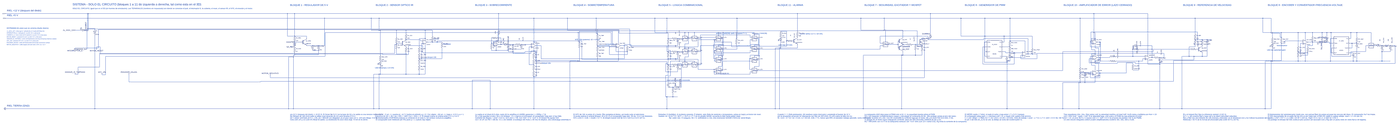
[diagram p0: schematic SISTEMA_SOLO_CIRCUITO.asc, whole sheet]
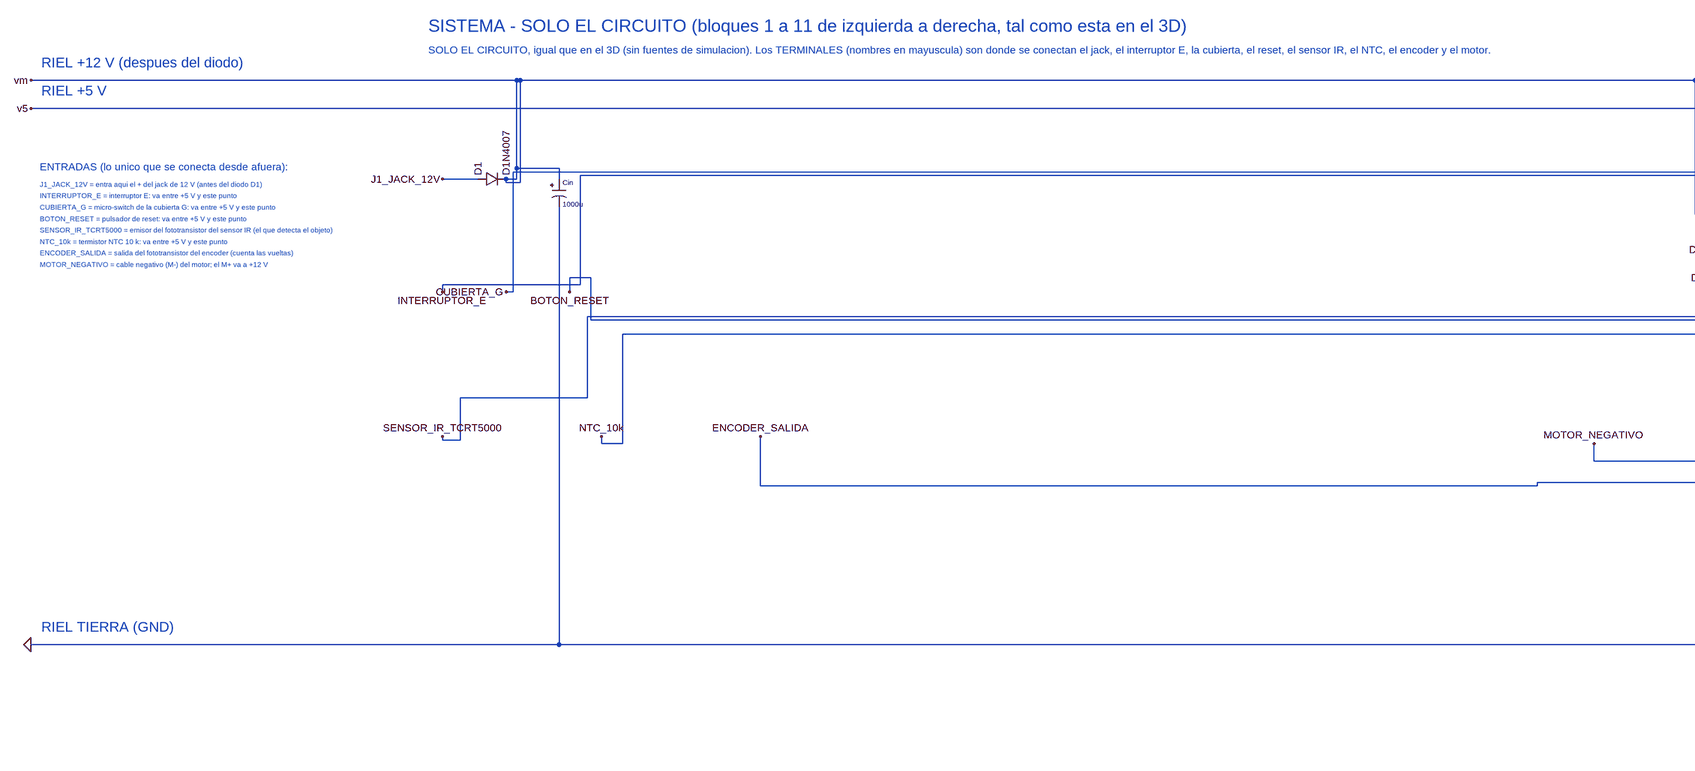
[diagram p1: schematic SISTEMA_SOLO_CIRCUITO.asc, part, row 1 of 1, column 1 of 5]
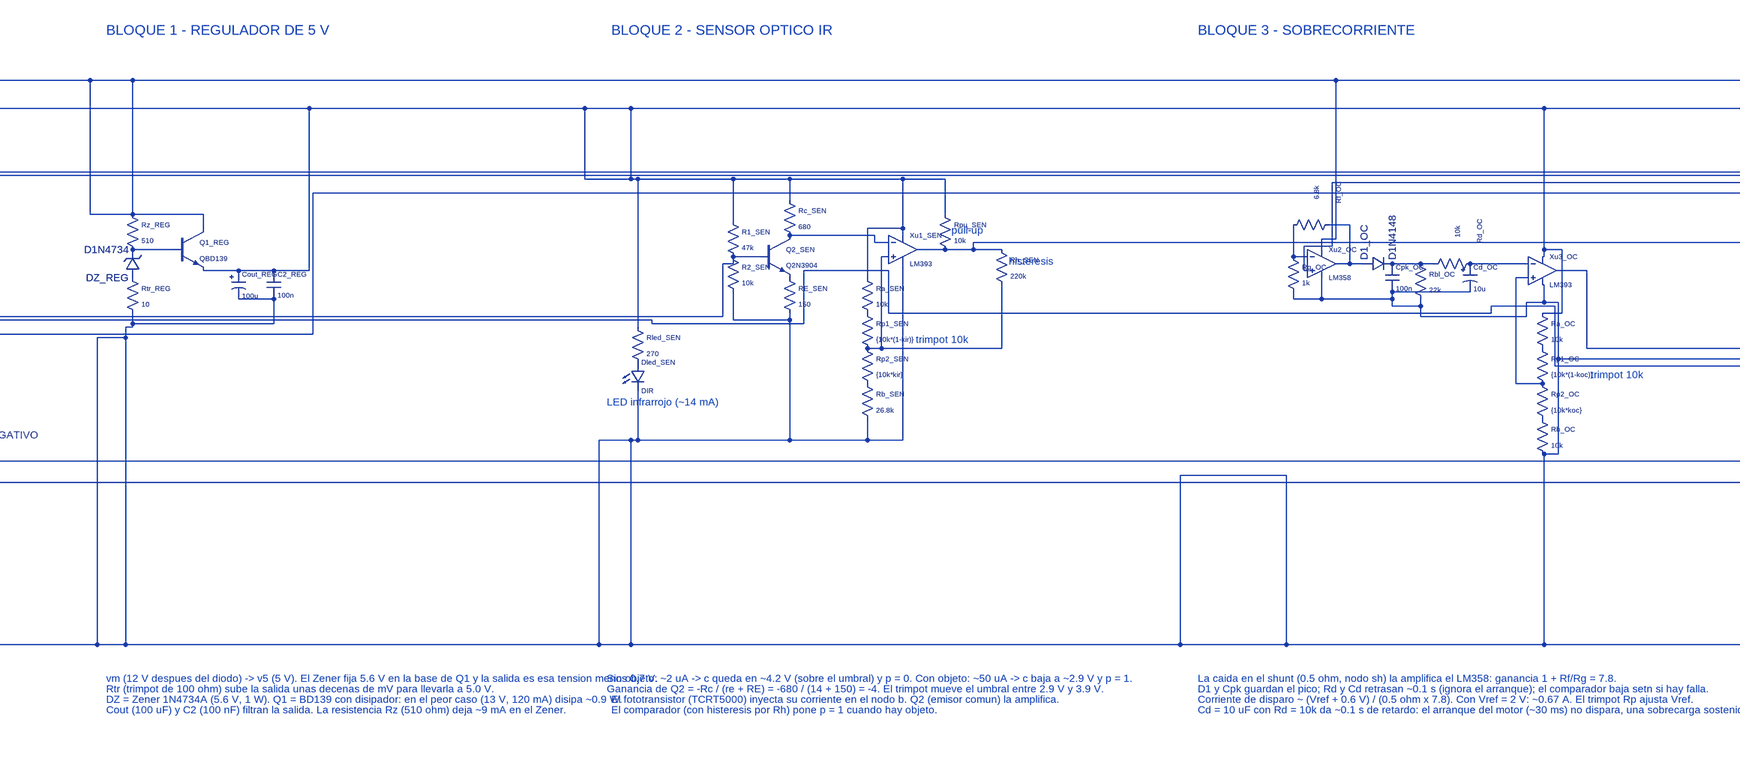
[diagram p2: schematic SISTEMA_SOLO_CIRCUITO.asc, part, row 1 of 1, column 2 of 5]
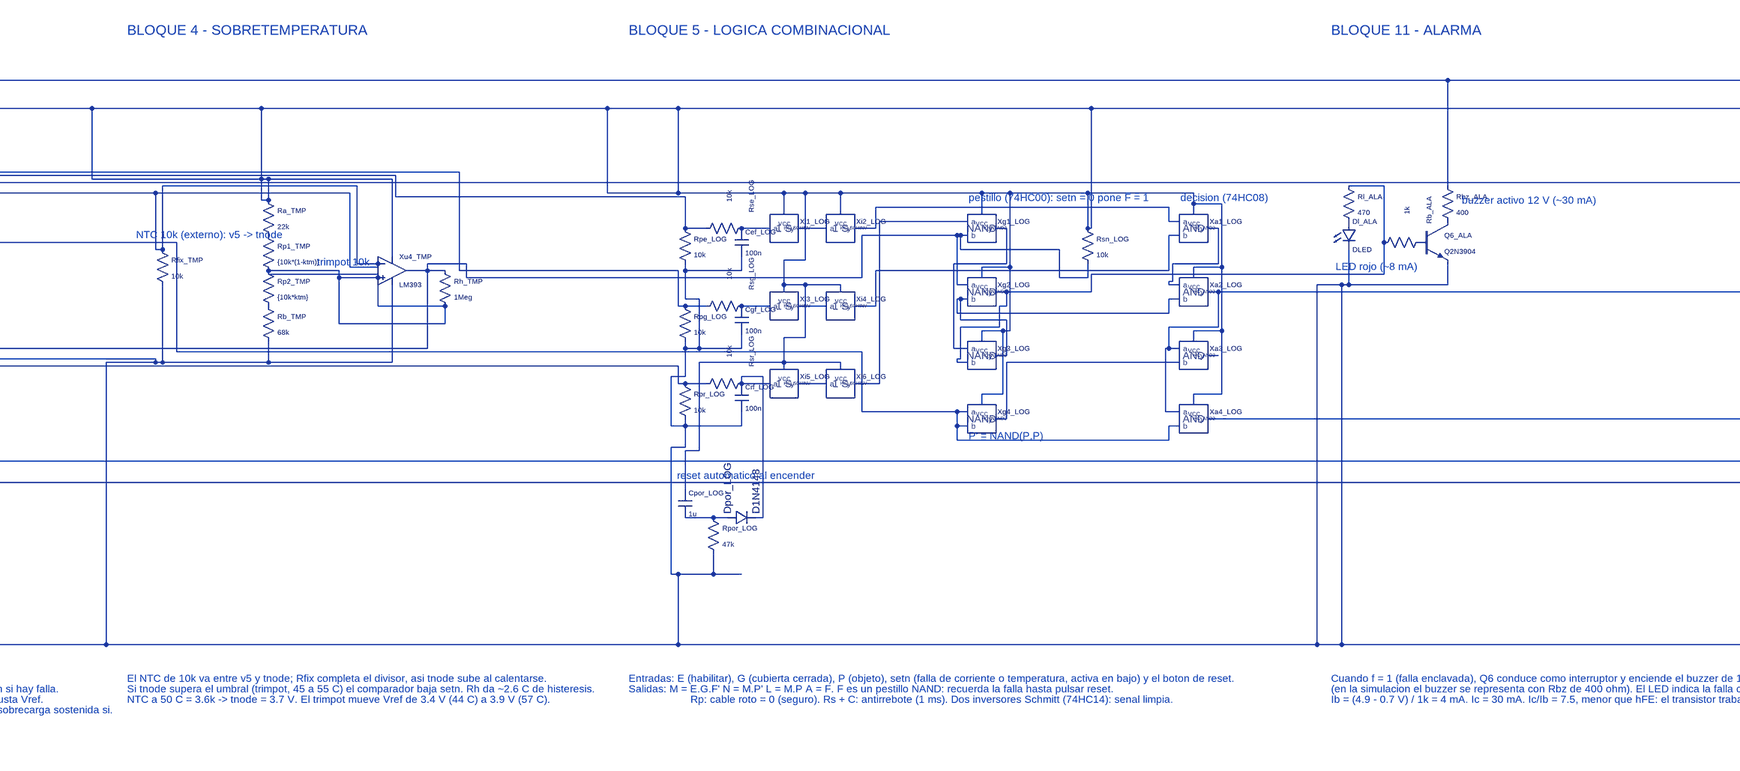
[diagram p3: schematic SISTEMA_SOLO_CIRCUITO.asc, part, row 1 of 1, column 3 of 5]
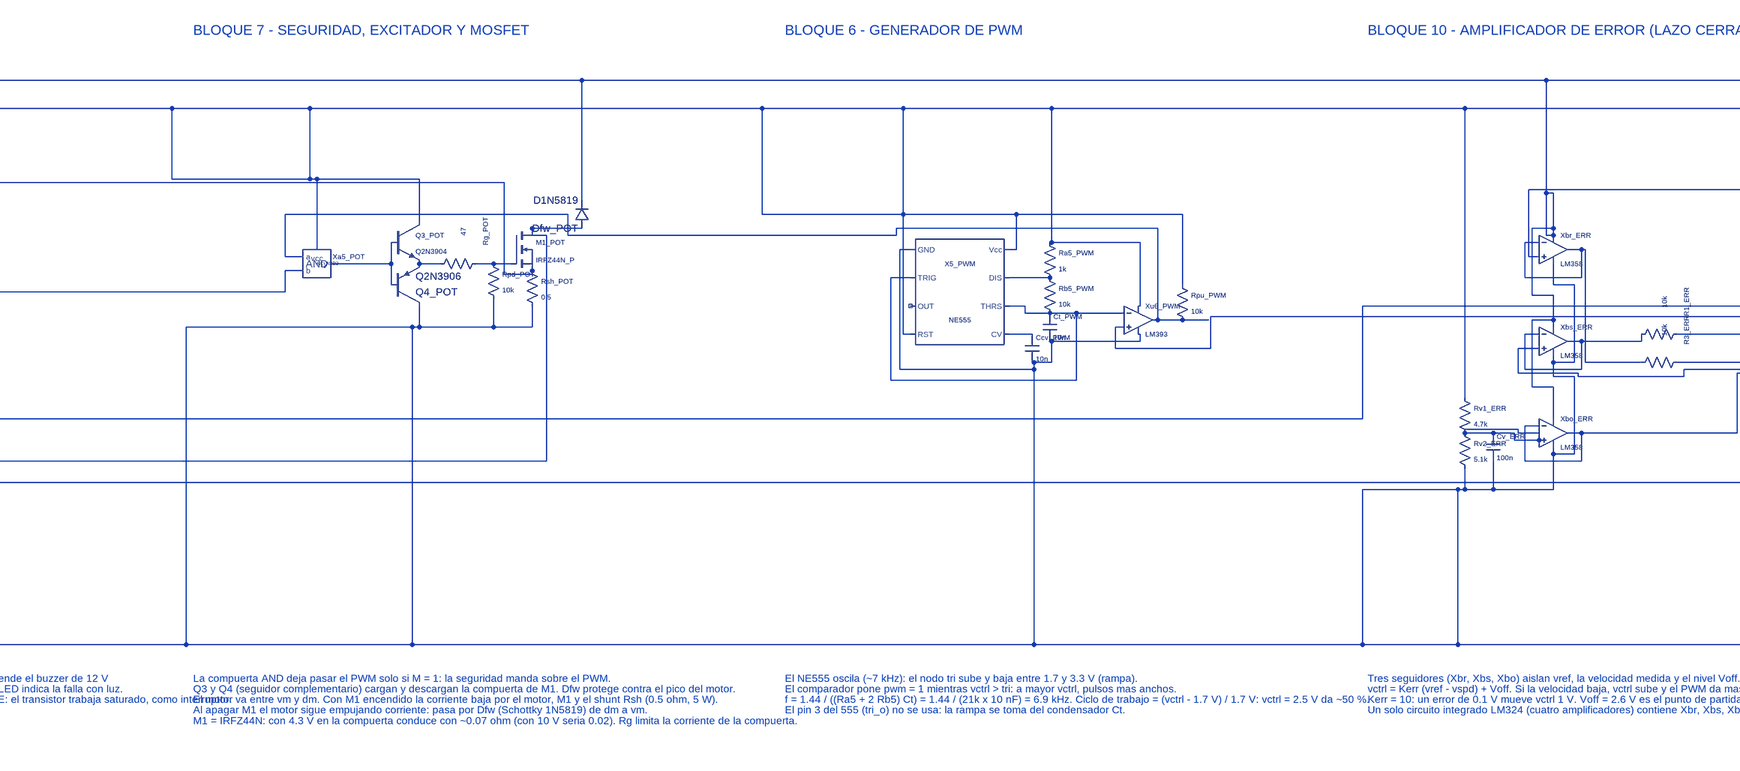
[diagram p4: schematic SISTEMA_SOLO_CIRCUITO.asc, part, row 1 of 1, column 4 of 5]
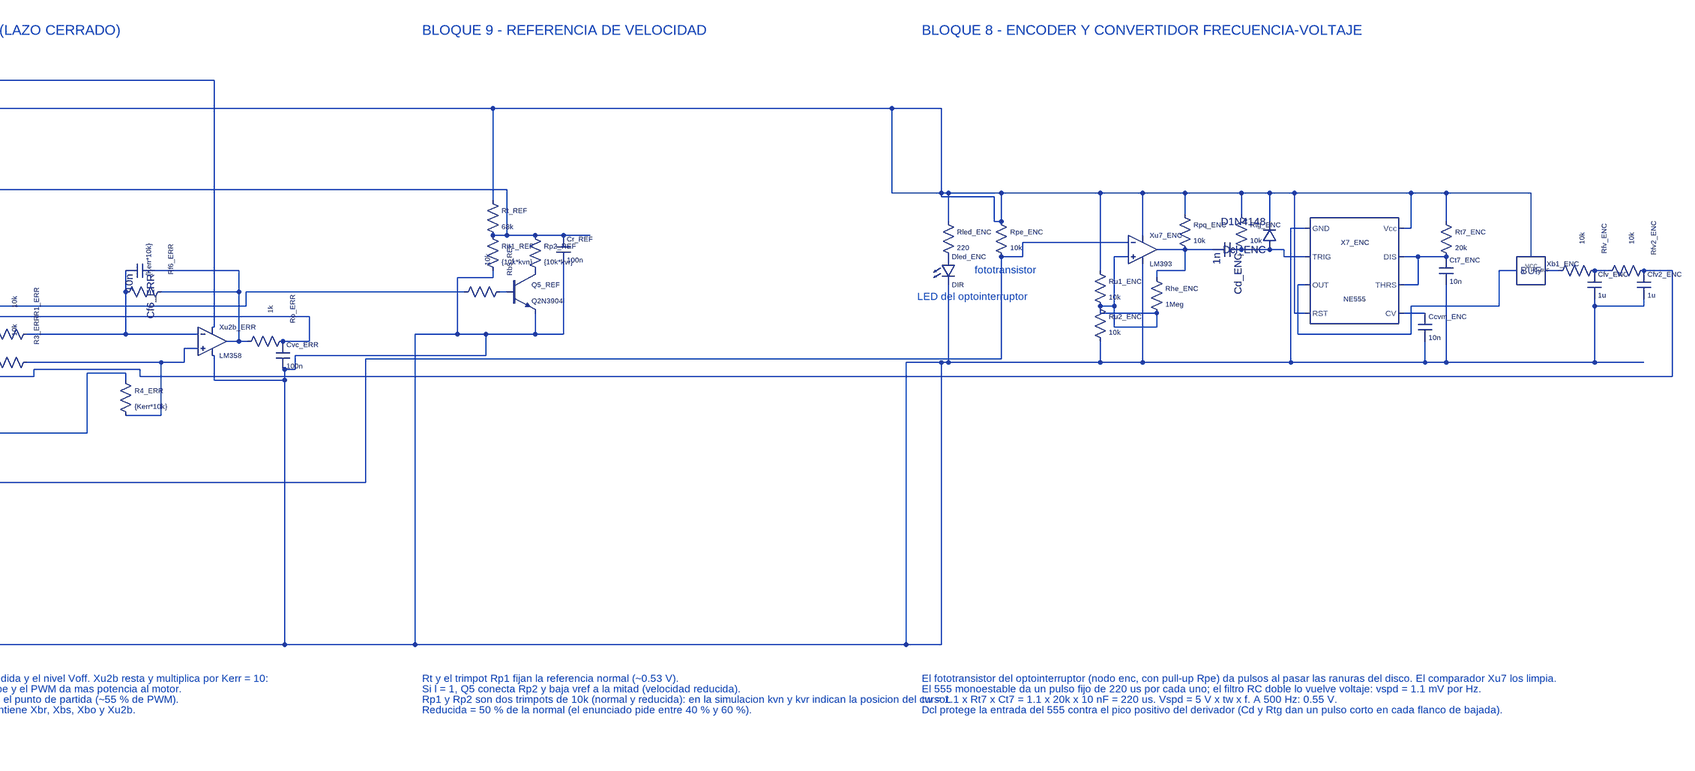
[diagram p5: schematic SISTEMA_SOLO_CIRCUITO.asc, part, row 1 of 1, column 5 of 5]
SISTEMA_SOLO_CIRCUITO.asc, the LTspice schematic file:
Version 4
SHEET 1 21000 4000
WIRE 4368 208 4464 208
WIRE 4368 128 4528 128
WIRE 4528 128 4528 160
WIRE 4528 256 4768 256
WIRE 5728 224 5792 224
WIRE 5856 176 6048 176
WIRE 6048 176 6048 192
WIRE 6048 192 6080 192
WIRE 6032 432 6064 432
WIRE 6064 224 6064 432
WIRE 6064 224 6080 224
WIRE 6144 208 6208 208
WIRE 6208 208 6272 208
WIRE 6272 208 6336 208
WIRE 6336 288 6336 432
WIRE 6064 432 6336 432
WIRE 5496 48 6208 48
WIRE 5856 48 5856 96
WIRE 6208 48 6208 128
WIRE 5728 48 5728 144
WIRE 6112 48 6112 176
WIRE 6032 160 6032 272
WIRE 6032 160 6112 160
WIRE 5512 48 5512 384
WIRE 5496 640 6112 640
WIRE 6032 592 6032 640
WIRE 5512 528 5512 640
WIRE 5856 352 5856 640
WIRE 5728 304 5728 368
WIRE 5728 368 5856 368
WIRE 6112 240 6112 640
WIRE 7000 224 7032 224
WIRE 7000 152 7000 224
WIRE 7080 152 7128 152
WIRE 7128 152 7128 240
WIRE 7096 240 7128 240
WIRE 7128 240 7160 240
WIRE 7224 240 7288 240
WIRE 7288 240 7320 240
WIRE 7400 240 7532 240
WIRE 7596 256 7664 256
WIRE 7504 512 7564 512
WIRE 7504 272 7504 512
WIRE 7504 272 7532 272
WIRE 8728 256 8776 256
WIRE 8776 256 8816 256
WIRE 8176 64 8176 208
WIRE 8176 64 8616 64
WIRE 8616 64 8616 240
WIRE 8616 240 8664 240
WIRE 8416 256 8576 256
WIRE 8576 256 8576 272
WIRE 8576 272 8664 272
WIRE 8816 336 8816 376
WIRE 8576 376 8816 376
WIRE 8576 272 8576 376
WIRE 8400 48 8696 48
WIRE 8416 48 8416 96
WIRE 8696 48 8696 224
WIRE 8160 464 8696 464
WIRE 8416 416 8416 464
WIRE 8176 288 8176 464
WIRE 8696 288 8696 464
WIRE 9360 160 9408 160
WIRE 9488 160 9552 160
WIRE 9616 160 9680 160
WIRE 9744 160 9792 160
WIRE 9360 336 9408 336
WIRE 9488 336 9552 336
WIRE 9616 336 9680 336
WIRE 9744 336 9792 336
WIRE 9360 512 9408 512
WIRE 9488 512 9552 512
WIRE 9616 512 9680 512
WIRE 9744 512 9792 512
WIRE 9360 816 9424 816
WIRE 9424 816 9456 816
WIRE 10064 160 10088 160
WIRE 10032 104 10032 128
WIRE 9976 144 10000 144
WIRE 9976 176 10000 176
WIRE 10064 304 10088 304
WIRE 10032 248 10032 272
WIRE 9976 288 10000 288
WIRE 9976 320 10000 320
WIRE 10064 448 10088 448
WIRE 10032 392 10032 416
WIRE 9976 432 10000 432
WIRE 9976 464 10000 464
WIRE 10064 592 10088 592
WIRE 10032 536 10032 560
WIRE 9976 576 10000 576
WIRE 9976 608 10000 608
WIRE 10544 160 10568 160
WIRE 10512 104 10512 128
WIRE 10456 144 10480 144
WIRE 10456 176 10480 176
WIRE 10544 304 10568 304
WIRE 10512 248 10512 272
WIRE 10456 288 10480 288
WIRE 10456 320 10480 320
WIRE 10544 448 10568 448
WIRE 10512 392 10512 416
WIRE 10456 432 10480 432
WIRE 10456 464 10480 464
WIRE 10544 592 10568 592
WIRE 10512 536 10512 560
WIRE 10456 576 10480 576
WIRE 10456 608 10480 608
WIRE 10456 112 10456 144
WIRE 9792 112 10456 112
WIRE 9792 112 9792 160
WIRE 10456 320 10456 352
WIRE 9976 352 10456 352
WIRE 9976 320 9976 352
WIRE 10456 176 10456 256
WIRE 9792 256 10456 256
WIRE 9792 256 9792 336
WIRE 10448 576 10456 576
WIRE 10448 432 10448 576
WIRE 10448 432 10456 432
WIRE 10568 160 10568 240
WIRE 10464 240 10568 240
WIRE 10464 240 10464 280
WIRE 10456 280 10464 280
WIRE 10456 280 10456 288
WIRE 10456 608 10456 640
WIRE 9976 640 10456 640
WIRE 9976 608 9976 640
WIRE 10088 464 10456 464
WIRE 10088 464 10088 592
WIRE 10088 160 10088 240
WIRE 9968 240 10088 240
WIRE 9968 240 9968 432
WIRE 9968 432 9976 432
WIRE 9520 816 9536 816
WIRE 9536 496 9536 816
WIRE 9488 496 9536 496
WIRE 9488 496 9488 512
WIRE 9800 144 9976 144
WIRE 9800 144 9800 512
WIRE 9792 512 9800 512
WIRE 9976 176 9976 288
WIRE 9344 80 10512 80
WIRE 10032 80 10032 104
WIRE 10512 80 10512 104
WIRE 9584 80 9584 128
WIRE 9712 80 9712 128
WIRE 10272 80 10272 160
WIRE 10032 248 10096 248
WIRE 10096 80 10096 248
WIRE 10512 248 10576 248
WIRE 10576 104 10576 248
WIRE 10512 104 10576 104
WIRE 10032 392 10096 392
WIRE 10096 248 10096 392
WIRE 10512 392 10576 392
WIRE 10576 248 10576 392
WIRE 10032 536 10080 536
WIRE 10080 392 10080 536
WIRE 10512 536 10576 536
WIRE 10576 392 10576 536
WIRE 9584 232 9584 304
WIRE 9584 232 9632 232
WIRE 9632 80 9632 232
WIRE 9712 288 9712 304
WIRE 9584 288 9712 288
WIRE 9584 408 9584 480
WIRE 9584 408 9632 408
WIRE 9632 288 9632 408
WIRE 9712 464 9712 480
WIRE 9584 464 9712 464
WIRE 9360 664 9360 752
WIRE 9360 664 9392 664
WIRE 9392 464 9392 664
WIRE 9392 464 9584 464
WIRE 9344 944 9488 944
WIRE 9424 896 9424 944
WIRE 9360 592 9360 656
WIRE 9328 656 9360 656
WIRE 9328 656 9328 944
WIRE 9328 944 9344 944
WIRE 9488 576 9488 608
WIRE 9360 608 9488 608
WIRE 9360 416 9360 496
WIRE 9328 496 9360 496
WIRE 9328 496 9328 608
WIRE 9328 608 9360 608
WIRE 9488 400 9488 432
WIRE 9360 432 9488 432
WIRE 9360 240 9360 320
WIRE 9360 320 9392 320
WIRE 9392 320 9392 432
WIRE 9488 224 9488 256
WIRE 9360 256 9488 256
WIRE 10992 288 11232 288
WIRE 11232 240 11232 288
WIRE 11008 208 11008 288
WIRE 12336 224 12376 224
WIRE 12336 256 12376 256
WIRE 12440 240 12576 240
WIRE 12576 192 12576 240
WIRE 12576 240 12576 288
WIRE 12640 240 12688 240
WIRE 12768 240 12848 240
WIRE 12896 160 13008 160
WIRE 12392 48 12640 48
WIRE 12640 48 12640 144
WIRE 12408 48 12408 208
WIRE 12624 384 12896 384
WIRE 12640 336 12640 384
WIRE 12896 336 12896 384
WIRE 12808 320 12808 384
WIRE 13976 272 14068 272
WIRE 13976 336 14012 336
WIRE 14012 336 14012 352
WIRE 14012 352 14068 352
WIRE 13976 400 14028 400
WIRE 14068 352 14128 352
WIRE 14128 352 14236 352
WIRE 13708 272 13752 272
WIRE 13708 272 13708 504
WIRE 13708 504 14128 504
WIRE 14128 352 14128 504
WIRE 14300 368 14368 368
WIRE 14368 368 14428 368
WIRE 13736 128 14368 128
WIRE 13976 208 13992 208
WIRE 13992 128 13992 208
WIRE 14368 128 14368 288
WIRE 13736 400 13752 400
WIRE 13736 128 13736 400
WIRE 15240 208 15272 208
WIRE 15272 208 15272 272
WIRE 15144 272 15272 272
WIRE 15144 192 15144 272
WIRE 15144 192 15176 192
WIRE 15240 416 15272 416
WIRE 15272 416 15272 480
WIRE 15144 480 15272 480
WIRE 15144 400 15144 480
WIRE 15144 400 15176 400
WIRE 15240 624 15272 624
WIRE 15272 624 15272 688
WIRE 15144 688 15272 688
WIRE 15144 608 15144 688
WIRE 15144 608 15176 608
WIRE 15008 624 15072 624
WIRE 15072 624 15120 624
WIRE 15120 624 15120 640
WIRE 15120 640 15176 640
WIRE 15488 400 15712 400
WIRE 15712 400 15876 400
WIRE 15488 464 15712 464
WIRE 15712 464 15792 464
WIRE 15792 464 15844 464
WIRE 15844 432 15844 464
WIRE 15844 432 15876 432
WIRE 15712 584 15792 584
WIRE 15792 464 15792 584
WIRE 15712 304 15712 400
WIRE 15792 304 15968 304
WIRE 15712 256 15712 304
WIRE 15776 256 15968 256
WIRE 15968 256 15968 304
WIRE 15968 304 15968 416
WIRE 15940 416 15968 416
WIRE 15968 416 15988 416
WIRE 16068 416 16128 416
WIRE 15712 488 15712 504
WIRE 15624 488 15712 488
WIRE 15624 488 15624 624
WIRE 15272 624 15624 624
WIRE 15280 464 15408 464
WIRE 15280 208 15280 464
WIRE 15272 208 15280 208
WIRE 15408 400 15408 416
WIRE 15272 416 15408 416
WIRE 15192 80 15208 80
WIRE 15208 80 15208 176
WIRE 15208 312 15208 384
WIRE 15160 312 15208 312
WIRE 15160 160 15160 312
WIRE 15160 160 15208 160
WIRE 15208 520 15208 592
WIRE 15160 520 15208 520
WIRE 15160 368 15160 520
WIRE 15160 368 15208 368
WIRE 14992 752 15208 752
WIRE 15008 704 15008 752
WIRE 15072 688 15072 752
WIRE 15208 656 15208 752
WIRE 15208 448 15208 496
WIRE 15208 496 15256 496
WIRE 15256 496 15256 672
WIRE 15208 672 15256 672
WIRE 15208 240 15208 288
WIRE 15208 288 15256 288
WIRE 15256 288 15256 464
WIRE 15208 464 15256 464
WIRE 16688 176 16784 176
WIRE 16784 176 16848 176
WIRE 16848 176 16908 176
WIRE 16704 304 16720 304
WIRE 16672 400 16848 400
WIRE 16784 352 16784 400
WIRE 16688 256 16688 272
WIRE 16608 272 16688 272
WIRE 16608 272 16608 400
WIRE 16848 240 16848 400
WIRE 17840 224 17888 224
WIRE 17888 192 17888 224
WIRE 17888 192 18128 192
WIRE 18064 336 18096 336
WIRE 18096 224 18096 336
WIRE 18096 224 18128 224
WIRE 18192 208 18256 208
WIRE 18256 208 18320 208
WIRE 18192 352 18192 384
WIRE 18096 384 18192 384
WIRE 18096 336 18096 384
WIRE 18384 208 18448 208
WIRE 18448 208 18480 208
WIRE 18480 208 18480 224
WIRE 18480 224 18528 224
WIRE 18752 224 18784 224
WIRE 18784 224 18784 288
WIRE 18752 288 18784 288
WIRE 18784 224 18848 224
WIRE 18752 352 18800 352
WIRE 18968 256 19008 256
WIRE 19072 256 19104 256
WIRE 19184 256 19216 256
WIRE 19296 256 19360 256
WIRE 18256 208 18256 256
WIRE 18192 256 18256 256
WIRE 18192 256 18192 272
WIRE 18968 256 18968 336
WIRE 18768 336 18968 336
WIRE 18768 336 18768 400
WIRE 18512 400 18768 400
WIRE 18512 288 18512 400
WIRE 18512 288 18528 288
WIRE 17704 80 19040 80
WIRE 18256 80 18256 128
WIRE 18384 80 18384 128
WIRE 17720 80 17720 144
WIRE 17840 80 17840 144
WIRE 18448 80 18448 144
WIRE 18848 80 18848 144
WIRE 18752 160 18768 160
WIRE 18768 80 18768 160
WIRE 18160 80 18160 176
WIRE 19040 80 19040 224
WIRE 18064 80 18064 256
WIRE 18504 352 18528 352
WIRE 18504 80 18504 352
WIRE 17704 464 19296 464
WIRE 18064 416 18064 464
WIRE 18800 416 18800 464
WIRE 19184 320 19184 464
WIRE 19296 320 19296 336
WIRE 19184 336 19296 336
WIRE 17720 288 17720 464
WIRE 18848 288 18848 464
WIRE 18160 240 18160 464
WIRE 18496 160 18528 160
WIRE 18496 160 18496 464
WIRE -900 -112 17704 -112
WIRE -900 -176 15912 -176
WIRE -900 1104 17704 1104
WIRE 4272 128 4368 128
WIRE 4272 -176 4272 128
WIRE 4288 408 4352 408
WIRE 4288 408 4288 1104
WIRE 5392 48 5496 48
WIRE 5392 -112 5392 48
WIRE 5424 640 5496 640
WIRE 5424 640 5424 1104
WIRE 6744 720 6984 720
WIRE 6744 720 6744 1104
WIRE 8016 48 8400 48
WIRE 8016 -112 8016 48
WIRE 8048 464 8160 464
WIRE 8048 464 8048 1104
WIRE 9184 80 9344 80
WIRE 9184 -112 9184 80
WIRE 10936 288 10992 288
WIRE 10936 288 10936 1104
WIRE 12080 48 12392 48
WIRE 12080 -112 12080 48
WIRE 12112 384 12624 384
WIRE 12112 384 12112 1104
WIRE 13416 128 13736 128
WIRE 13416 -112 13416 128
WIRE 14776 752 14992 752
WIRE 14776 752 14776 1104
WIRE 16512 400 16672 400
WIRE 16512 400 16512 1104
WIRE 17592 80 17704 80
WIRE 17592 -112 17592 80
WIRE 17624 464 17704 464
WIRE 17624 464 17624 1104
WIRE 12896 160 12896 176
WIRE 12896 176 12928 176
WIRE 12928 176 12928 688
WIRE 2784 688 12928 688
WIRE 2784 648 2784 688
WIRE 9360 88 9360 160
WIRE 8704 88 9360 88
WIRE 8704 40 8704 88
WIRE 344 40 8704 40
WIRE 344 40 344 288
WIRE 32 288 344 288
WIRE 32 288 32 304
WIRE 17840 224 17840 456
WIRE 16376 456 17840 456
WIRE 16376 456 16376 736
WIRE 2656 736 16376 736
WIRE 2656 736 2656 744
WIRE 752 744 2656 744
WIRE 752 632 752 744
WIRE 10088 368 10088 448
WIRE 9984 368 10088 368
WIRE 9984 320 9984 368
WIRE 9344 336 9360 336
WIRE 9344 256 9344 336
WIRE 8848 256 9344 256
WIRE 8848 32 8848 256
WIRE 192 32 8848 32
WIRE 192 32 192 304
WIRE 176 304 192 304
WIRE 15984 304 16624 304
WIRE 15984 304 15984 336
WIRE 14776 336 15984 336
WIRE 14776 336 14776 592
WIRE 10568 592 14776 592
WIRE 9344 512 9360 512
WIRE 9344 472 9344 512
WIRE 7592 472 9344 472
WIRE 7592 336 7592 472
WIRE 7448 336 7592 336
WIRE 7448 336 7448 352
WIRE 6080 352 7448 352
WIRE 6080 256 6080 352
WIRE 5888 256 6080 256
WIRE 5888 256 5888 376
WIRE 5544 376 5888 376
WIRE 5544 368 5544 376
WIRE 368 368 5544 368
WIRE 368 272 368 368
WIRE 320 272 368 272
WIRE 320 272 320 304
WIRE 19360 256 19360 496
WIRE 15744 496 19360 496
WIRE 15744 480 15744 496
WIRE 15504 480 15744 480
WIRE 15504 480 15504 496
WIRE 15264 496 15504 496
WIRE 15264 488 15264 496
WIRE 15128 488 15264 488
WIRE 15128 432 15128 488
WIRE 15128 432 15176 432
WIRE 10568 304 10568 384
WIRE 10456 384 10568 384
WIRE 10456 384 10456 432
WIRE 12336 256 12336 304
WIRE 10568 304 12336 304
WIRE 9760 576 9976 576
WIRE 9760 440 9760 576
WIRE 8208 440 9760 440
WIRE 8208 192 8208 440
WIRE 6272 192 8208 192
WIRE 6272 192 6272 208
WIRE 9976 576 9976 608
WIRE 8160 208 8176 208
WIRE 8160 80 8160 208
WIRE 4776 80 8160 80
WIRE 4776 80 4776 400
WIRE 440 400 4776 400
WIRE 440 400 440 648
WIRE 392 648 440 648
WIRE 392 632 392 648
WIRE 8664 240 8664 248
WIRE 8600 248 8664 248
WIRE 8600 80 8600 248
WIRE 8160 80 8600 80
WIRE 8776 256 8776 432
WIRE 7664 432 8776 432
WIRE 7664 256 7664 432
WIRE 9760 176 9976 176
WIRE 9760 176 9760 272
WIRE 8864 272 9760 272
WIRE 8864 240 8864 272
WIRE 8776 240 8864 240
WIRE 8776 240 8776 256
WIRE 10272 240 10272 272
WIRE 10208 272 10272 272
WIRE 10208 208 10208 272
WIRE 9984 208 10208 208
WIRE 9984 176 9984 208
WIRE 5728 224 5728 240
WIRE 5704 240 5728 240
WIRE 5704 240 5704 360
WIRE 360 360 5704 360
WIRE 360 360 360 544
WIRE 72 544 360 544
WIRE 72 544 72 640
WIRE 32 640 72 640
WIRE 32 632 32 640
WIRE 18064 352 18192 352
WIRE 18064 336 18064 352
WIRE 15176 624 15176 640
WIRE 15128 624 15176 624
WIRE 15128 616 15128 624
WIRE 15008 616 15128 616
WIRE 15008 616 15008 624
WIRE 12896 256 12896 264
WIRE 12832 264 12896 264
WIRE 12832 56 12832 264
WIRE 7088 56 12832 56
WIRE 7088 56 7088 200
WIRE 7024 200 7088 200
WIRE 7024 200 7024 256
WIRE 7024 256 7032 256
WIRE 8664 264 8664 272
WIRE 8416 264 8664 264
WIRE 8416 256 8416 264
WIRE 8664 336 8816 336
WIRE 8664 272 8664 336
WIRE 10088 304 10088 336
WIRE 10072 336 10088 336
WIRE 10072 336 10072 384
WIRE 9984 384 10072 384
WIRE 9984 384 9984 456
WIRE 9976 456 9984 456
WIRE 9976 456 9976 464
WIRE 11088 192 11088 264
WIRE 10280 264 11088 264
WIRE 10280 264 10280 304
WIRE 10088 304 10280 304
WIRE 11008 64 11088 64
WIRE 11088 64 11088 192
WIRE 5496 -112 5496 48
WIRE 8400 -112 8400 48
WIRE 8400 96 8416 96
WIRE 8400 48 8400 96
WIRE 12392 -112 12392 48
WIRE 9344 -112 9344 80
WIRE 17704 -112 17704 80
WIRE 17824 144 17840 144
WIRE 17824 88 17824 144
WIRE 17704 88 17824 88
WIRE 17704 80 17704 88
WIRE 16688 -112 16688 96
WIRE 13736 -112 13736 128
WIRE 10272 160 10280 160
WIRE 10280 -112 10280 160
WIRE 4768 -112 4768 256
WIRE 15008 -112 15008 544
WIRE 176 48 200 48
WIRE 200 -176 200 48
WIRE 296 24 296 48
WIRE 200 24 296 24
WIRE 11232 -176 11232 64
WIRE 15192 -176 15192 80
WIRE 15192 176 15208 176
WIRE 15192 80 15192 176
WIRE 13008 -176 13008 96
WIRE 4368 -176 4368 128
WIRE 7064 184 7064 208
WIRE 7064 184 7096 184
WIRE 7096 -176 7096 184
WIRE 7564 224 7568 224
WIRE 7564 288 7568 288
WIRE 7564 352 7568 352
WIRE 7564 672 7568 672
WIRE 14068 192 14072 192
WIRE 14068 416 14072 416
WIRE 14028 464 14032 464
WIRE 14232 384 14236 384
WIRE 14268 336 14272 336
WIRE 14268 400 14272 400
WIRE 15908 384 15912 384
WIRE 15908 448 15912 448
WIRE 16068 480 16072 480
WIRE 9344 944 9344 1104
WIRE 14992 752 14992 1104
WIRE 6984 720 6984 1104
WIRE 7568 672 7568 1104
WIRE 7568 288 7568 328
WIRE 7568 328 7600 328
WIRE 7600 328 7600 672
WIRE 7568 672 7600 672
WIRE 7288 320 7288 360
WIRE 7288 360 7528 360
WIRE 7528 328 7528 360
WIRE 7528 328 7568 328
WIRE 7224 304 7224 336
WIRE 7224 336 7288 336
WIRE 7064 272 7064 320
WIRE 7064 320 7224 320
WIRE 7000 304 7000 320
WIRE 7000 320 7064 320
WIRE 5496 640 5496 1104
WIRE 8160 456 8160 464
WIRE 7600 456 8160 456
WIRE 16072 480 16072 1104
WIRE 15912 448 15912 504
WIRE 15912 504 16072 504
WIRE 14032 464 14032 1104
WIRE 14072 416 14072 464
WIRE 14032 464 14072 464
WIRE 14272 400 14272 416
WIRE 14072 416 14272 416
WIRE 13728 208 13752 208
WIRE 13728 208 13728 480
WIRE 13728 480 14032 480
WIRE 17704 464 17704 1104
WIRE 16672 400 16672 448
WIRE 16096 448 16672 448
WIRE 16096 448 16096 480
WIRE 16072 480 16096 480
WIRE 4352 408 4352 1104
WIRE 4368 352 4368 384
WIRE 4352 384 4368 384
WIRE 4352 384 4352 408
WIRE 4688 320 4688 376
WIRE 4368 376 4688 376
WIRE 12624 384 12624 1104
WIRE 10992 288 10992 1104
WIRE 14072 -112 14072 192
WIRE 7568 -112 7568 224
WIRE 7568 352 7608 352
WIRE 7608 208 7608 352
WIRE 7568 208 7608 208
WIRE 14272 192 14272 336
WIRE 14072 192 14272 192
WIRE 176 48 176 56
WIRE 176 56 208 56
WIRE 208 -176 208 56
WIRE 15912 -176 15912 384
WIRE 16128 360 16128 416
WIRE 14432 360 16128 360
WIRE 14432 360 14432 432
WIRE 14216 432 14432 432
WIRE 14216 384 14216 432
WIRE 14216 384 14232 384
WIRE 32 48 112 48
WIRE 4608 320 4688 320
WIRE 7400 304 7224 304
WIRE 15176 224 15152 224
WIRE 15152 224 15152 72
WIRE 15152 72 16720 72
WIRE 16720 72 16720 176
WIRE 12336 224 12336 128
WIRE 12336 128 12976 128
WIRE 12976 128 12976 176
WIRE 12976 176 13720 176
WIRE 13720 176 13720 160
WIRE 13720 160 14312 160
WIRE 14312 160 14312 368
WIRE 296 112 296 1104
FLAG 32 48 J1_JACK_12V
FLAG 32 304 INTERRUPTOR_E
FLAG 176 304 CUBIERTA_G
FLAG 320 304 BOTON_RESET
FLAG 32 632 SENSOR_IR_TCRT5000
FLAG 392 632 NTC_10k
FLAG 752 632 ENCODER_SALIDA
FLAG 2784 648 MOTOR_NEGATIVO
FLAG -900 -112 v5
FLAG -900 -176 vm
FLAG -900 1104 0
SYMBOL diode 112 64 R270
SYMATTR InstName D1
SYMATTR Value D1N4007
SYMBOL polcap 280 48 R0
WINDOW 0 24 8 Left 1
WINDOW 3 24 57 Left 1
SYMATTR InstName Cin
SYMATTR Value 1000u
SYMBOL res 4352 112 R0
WINDOW 0 36 40 Left 1
WINDOW 3 36 76 Left 1
SYMATTR InstName Rz_REG
SYMATTR Value 510
SYMBOL zener 4384 272 R180
SYMATTR InstName DZ_REG
SYMATTR Value D1N4734
SYMBOL res 4352 256 R0
WINDOW 0 36 40 Left 1
WINDOW 3 36 76 Left 1
SYMATTR InstName Rtr_REG
SYMATTR Value 10
SYMBOL npn 4464 160 R0
WINDOW 0 56 32 Left 1
WINDOW 3 56 68 Left 1
SYMATTR InstName Q1_REG
SYMATTR Value QBD139
SYMBOL polcap 4592 256 R0
WINDOW 0 24 8 Left 1
WINDOW 3 24 57 Left 1
SYMATTR InstName Cout_REG
SYMATTR Value 100u
SYMBOL cap 4672 256 R0
WINDOW 0 24 8 Left 1
WINDOW 3 24 56 Left 1
SYMATTR InstName C2_REG
SYMATTR Value 100n
SYMBOL res 5496 368 R0
WINDOW 0 36 40 Left 1
WINDOW 3 36 76 Left 1
SYMATTR InstName Rled_SEN
SYMATTR Value 270
SYMBOL LED 5496 464 R0
WINDOW 0 24 0 Left 1
WINDOW 3 24 64 Left 1
SYMATTR InstName Dled_SEN
SYMATTR Value DIR
SYMBOL res 5712 128 R0
WINDOW 0 36 40 Left 1
WINDOW 3 36 76 Left 1
SYMATTR InstName R1_SEN
SYMATTR Value 47k
SYMBOL res 5712 208 R0
WINDOW 0 36 40 Left 1
WINDOW 3 36 76 Left 1
SYMATTR InstName R2_SEN
SYMATTR Value 10k
SYMBOL npn 5792 176 R0
WINDOW 0 56 32 Left 1
WINDOW 3 56 68 Left 1
SYMATTR InstName Q2_SEN
SYMATTR Value Q2N3904
SYMBOL res 5840 80 R0
WINDOW 0 36 40 Left 1
WINDOW 3 36 76 Left 1
SYMATTR InstName Rc_SEN
SYMATTR Value 680
SYMBOL res 5840 256 R0
WINDOW 0 36 40 Left 1
WINDOW 3 36 76 Left 1
SYMATTR InstName RE_SEN
SYMATTR Value 150
SYMBOL res 6016 256 R0
WINDOW 0 36 40 Left 1
WINDOW 3 36 76 Left 1
SYMATTR InstName Ra_SEN
SYMATTR Value 10k
SYMBOL res 6016 336 R0
WINDOW 0 36 40 Left 1
WINDOW 3 36 76 Left 1
SYMATTR InstName Rp1_SEN
SYMATTR Value {10k*(1-kir)}
SYMBOL res 6016 416 R0
WINDOW 0 36 40 Left 1
WINDOW 3 36 76 Left 1
SYMATTR InstName Rp2_SEN
SYMATTR Value {10k*kir}
SYMBOL res 6016 496 R0
WINDOW 0 36 40 Left 1
WINDOW 3 36 76 Left 1
SYMATTR InstName Rb_SEN
SYMATTR Value 26.8k
SYMBOL OpAmps\opamp2 6112 144 R0
WINDOW 0 16 32 Left 1
WINDOW 3 16 96 Left 1
SYMATTR InstName Xu1_SEN
SYMATTR Value LM393
SYMBOL res 6192 112 R0
WINDOW 0 36 40 Left 1
WINDOW 3 36 76 Left 1
SYMATTR InstName Rpu_SEN
SYMATTR Value 10k
SYMBOL res 6320 192 R0
WINDOW 0 36 40 Left 1
WINDOW 3 36 76 Left 1
SYMATTR InstName Rh_SEN
SYMATTR Value 220k
SYMBOL OpAmps\opamp2 7064 176 R0
WINDOW 0 16 32 Left 1
WINDOW 3 16 96 Left 1
SYMATTR InstName Xu2_OC
SYMATTR Value LM358
SYMBOL res 6984 208 R0
WINDOW 0 36 40 Left 1
WINDOW 3 36 76 Left 1
SYMATTR InstName Rg_OC
SYMATTR Value 1k
SYMBOL res 7096 136 R90
WINDOW 0 -56 -6 Center 1
WINDOW 3 -56 44 Center 1
SYMATTR InstName Rf_OC
SYMATTR Value 6.8k
SYMBOL diode 7160 256 R270
SYMATTR InstName D1_OC
SYMATTR Value D1N4148
SYMBOL cap 7208 240 R0
WINDOW 0 24 8 Left 1
WINDOW 3 24 56 Left 1
SYMATTR InstName Cpk_OC
SYMATTR Value 100n
SYMBOL res 7272 224 R0
WINDOW 0 36 40 Left 1
WINDOW 3 36 76 Left 1
SYMATTR InstName Rbl_OC
SYMATTR Value 22k
SYMBOL res 7416 224 R90
WINDOW 0 -56 -6 Center 1
WINDOW 3 -56 44 Center 1
SYMATTR InstName Rd_OC
SYMATTR Value 10k
SYMBOL polcap 7384 240 R0
WINDOW 0 24 8 Left 1
WINDOW 3 24 57 Left 1
SYMATTR InstName Cd_OC
SYMATTR Value 10u
SYMBOL OpAmps\opamp2 7564 192 R0
WINDOW 0 16 32 Left 1
WINDOW 3 16 96 Left 1
SYMATTR InstName Xu3_OC
SYMATTR Value LM393
SYMBOL res 7548 336 R0
WINDOW 0 36 40 Left 1
WINDOW 3 36 76 Left 1
SYMATTR InstName Ra_OC
SYMATTR Value 10k
SYMBOL res 7548 416 R0
WINDOW 0 36 40 Left 1
WINDOW 3 36 76 Left 1
SYMATTR InstName Rp1_OC
SYMATTR Value {10k*(1-koc)}
SYMBOL res 7548 496 R0
WINDOW 0 36 40 Left 1
WINDOW 3 36 76 Left 1
SYMATTR InstName Rp2_OC
SYMATTR Value {10k*koc}
SYMBOL res 7548 576 R0
WINDOW 0 36 40 Left 1
WINDOW 3 36 76 Left 1
SYMATTR InstName Rb_OC
SYMATTR Value 10k
SYMBOL res 8160 192 R0
WINDOW 0 36 40 Left 1
WINDOW 3 36 76 Left 1
SYMATTR InstName Rfix_TMP
SYMATTR Value 10k
SYMBOL res 8400 80 R0
WINDOW 0 36 40 Left 1
WINDOW 3 36 76 Left 1
SYMATTR InstName Ra_TMP
SYMATTR Value 22k
SYMBOL res 8400 160 R0
WINDOW 0 36 40 Left 1
WINDOW 3 36 76 Left 1
SYMATTR InstName Rp1_TMP
SYMATTR Value {10k*(1-ktm)}
SYMBOL res 8400 240 R0
WINDOW 0 36 40 Left 1
WINDOW 3 36 76 Left 1
SYMATTR InstName Rp2_TMP
SYMATTR Value {10k*ktm}
SYMBOL res 8400 320 R0
WINDOW 0 36 40 Left 1
WINDOW 3 36 76 Left 1
SYMATTR InstName Rb_TMP
SYMATTR Value 68k
SYMBOL OpAmps\opamp2 8696 192 R0
WINDOW 0 16 32 Left 1
WINDOW 3 16 96 Left 1
SYMATTR InstName Xu4_TMP
SYMATTR Value LM393
SYMBOL res 8800 240 R0
WINDOW 0 36 40 Left 1
WINDOW 3 36 76 Left 1
SYMATTR InstName Rh_TMP
SYMATTR Value 1Meg
SYMBOL res 9344 144 R0
WINDOW 0 36 40 Left 1
WINDOW 3 36 76 Left 1
SYMATTR InstName Rpe_LOG
SYMATTR Value 10k
SYMBOL res 9504 144 R90
WINDOW 0 -56 -6 Center 1
WINDOW 3 -56 44 Center 1
SYMATTR InstName Rse_LOG
SYMATTR Value 10k
SYMBOL cap 9472 160 R0
WINDOW 0 24 8 Left 1
WINDOW 3 24 56 Left 1
SYMATTR InstName Cef_LOG
SYMATTR Value 100n
SYMBOL HC_SCHINV 9584 160 R0
WINDOW 0 36 -16 Left 1
WINDOW 3 0 0 Left 0
SYMATTR InstName Xi1_LOG
SYMATTR Value HC_SCHINV
SYMBOL HC_SCHINV 9712 160 R0
WINDOW 0 36 -16 Left 1
WINDOW 3 0 0 Left 0
SYMATTR InstName Xi2_LOG
SYMATTR Value HC_SCHINV
SYMBOL res 9344 320 R0
WINDOW 0 36 40 Left 1
WINDOW 3 36 76 Left 1
SYMATTR InstName Rpg_LOG
SYMATTR Value 10k
SYMBOL res 9504 320 R90
WINDOW 0 -56 -6 Center 1
WINDOW 3 -56 44 Center 1
SYMATTR InstName Rsg_LOG
SYMATTR Value 10k
SYMBOL cap 9472 336 R0
WINDOW 0 24 8 Left 1
WINDOW 3 24 56 Left 1
SYMATTR InstName Cgf_LOG
SYMATTR Value 100n
SYMBOL HC_SCHINV 9584 336 R0
WINDOW 0 36 -16 Left 1
WINDOW 3 0 0 Left 0
SYMATTR InstName Xi3_LOG
SYMATTR Value HC_SCHINV
SYMBOL HC_SCHINV 9712 336 R0
WINDOW 0 36 -16 Left 1
WINDOW 3 0 0 Left 0
SYMATTR InstName Xi4_LOG
SYMATTR Value HC_SCHINV
SYMBOL res 9344 496 R0
WINDOW 0 36 40 Left 1
WINDOW 3 36 76 Left 1
SYMATTR InstName Rpr_LOG
SYMATTR Value 10k
SYMBOL res 9504 496 R90
WINDOW 0 -56 -6 Center 1
WINDOW 3 -56 44 Center 1
SYMATTR InstName Rsr_LOG
SYMATTR Value 10k
SYMBOL cap 9472 512 R0
WINDOW 0 24 8 Left 1
WINDOW 3 24 56 Left 1
SYMATTR InstName Crf_LOG
SYMATTR Value 100n
SYMBOL HC_SCHINV 9584 512 R0
WINDOW 0 36 -16 Left 1
WINDOW 3 0 0 Left 0
SYMATTR InstName Xi5_LOG
SYMATTR Value HC_SCHINV
SYMBOL HC_SCHINV 9712 512 R0
WINDOW 0 36 -16 Left 1
WINDOW 3 0 0 Left 0
SYMATTR InstName Xi6_LOG
SYMATTR Value HC_SCHINV
SYMBOL cap 9344 752 R0
WINDOW 0 24 8 Left 1
WINDOW 3 24 56 Left 1
SYMATTR InstName Cpor_LOG
SYMATTR Value 1u
SYMBOL res 9408 800 R0
WINDOW 0 36 40 Left 1
WINDOW 3 36 76 Left 1
SYMATTR InstName Rpor_LOG
SYMATTR Value 47k
SYMBOL diode 9456 832 R270
SYMATTR InstName Dpor_LOG
SYMATTR Value D1N4148
SYMBOL HC_NAND2 10032 160 R0
WINDOW 0 36 -16 Left 1
WINDOW 3 0 0 Left 0
SYMATTR InstName Xg1_LOG
SYMATTR Value HC_NAND2
SYMBOL HC_NAND2 10032 304 R0
WINDOW 0 36 -16 Left 1
WINDOW 3 0 0 Left 0
SYMATTR InstName Xg2_LOG
SYMATTR Value HC_NAND2
SYMBOL HC_NAND2 10032 448 R0
WINDOW 0 36 -16 Left 1
WINDOW 3 0 0 Left 0
SYMATTR InstName Xg3_LOG
SYMATTR Value HC_NAND2
SYMBOL HC_NAND2 10032 592 R0
WINDOW 0 36 -16 Left 1
WINDOW 3 0 0 Left 0
SYMATTR InstName Xg4_LOG
SYMATTR Value HC_NAND2
SYMBOL res 10256 144 R0
WINDOW 0 36 40 Left 1
WINDOW 3 36 76 Left 1
SYMATTR InstName Rsn_LOG
SYMATTR Value 10k
SYMBOL HC_AND2 10512 160 R0
WINDOW 0 36 -16 Left 1
WINDOW 3 0 0 Left 0
SYMATTR InstName Xa1_LOG
SYMATTR Value HC_AND2
SYMBOL HC_AND2 10512 304 R0
WINDOW 0 36 -16 Left 1
WINDOW 3 0 0 Left 0
SYMATTR InstName Xa2_LOG
SYMATTR Value HC_AND2
SYMBOL HC_AND2 10512 448 R0
WINDOW 0 36 -16 Left 1
WINDOW 3 0 0 Left 0
SYMATTR InstName Xa3_LOG
SYMATTR Value HC_AND2
SYMBOL HC_AND2 10512 592 R0
WINDOW 0 36 -16 Left 1
WINDOW 3 0 0 Left 0
SYMATTR InstName Xa4_LOG
SYMATTR Value HC_AND2
SYMBOL res 11184 176 R90
WINDOW 0 -56 -6 Center 1
WINDOW 3 -56 44 Center 1
SYMATTR InstName Rb_ALA
SYMATTR Value 1k
SYMBOL npn 11168 144 R0
WINDOW 0 56 32 Left 1
WINDOW 3 56 68 Left 1
SYMATTR InstName Q6_ALA
SYMATTR Value Q2N3904
SYMBOL res 11216 48 R0
WINDOW 0 36 40 Left 1
WINDOW 3 36 76 Left 1
SYMATTR InstName Rbz_ALA
SYMATTR Value 400
SYMBOL res 10992 48 R0
WINDOW 0 36 40 Left 1
WINDOW 3 36 76 Left 1
SYMATTR InstName Rl_ALA
SYMATTR Value 470
SYMBOL LED 10992 144 R0
WINDOW 0 24 0 Left 1
WINDOW 3 24 64 Left 1
SYMATTR InstName Dl_ALA
SYMATTR Value DLED
SYMBOL HC_AND2 12408 240 R0
WINDOW 0 36 -16 Left 1
WINDOW 3 0 0 Left 0
SYMATTR InstName Xa5_POT
SYMATTR Value HC_AND2
SYMBOL npn 12576 144 R0
WINDOW 0 56 32 Left 1
WINDOW 3 56 68 Left 1
SYMATTR InstName Q3_POT
SYMATTR Value Q2N3904
SYMBOL pnp 12576 336 M180
SYMATTR InstName Q4_POT
SYMATTR Value Q2N3906
SYMBOL res 12784 224 R90
WINDOW 0 -56 -6 Center 1
WINDOW 3 -56 44 Center 1
SYMATTR InstName Rg_POT
SYMATTR Value 47
SYMBOL res 12792 224 R0
WINDOW 0 36 40 Left 1
WINDOW 3 36 76 Left 1
SYMATTR InstName Rpd_POT
SYMATTR Value 10k
SYMBOL nmos 12848 160 R0
WINDOW 0 56 32 Left 1
WINDOW 3 56 72 Left 1
SYMATTR InstName M1_POT
SYMATTR Value IRFZ44N_P
SYMBOL diode 13024 160 R180
SYMATTR InstName Dfw_POT
SYMATTR Value D1N5819
SYMBOL res 12880 240 R0
WINDOW 0 36 40 Left 1
WINDOW 3 36 76 Left 1
SYMATTR InstName Rsh_POT
SYMATTR Value 0.5
SYMBOL Misc\NE555 13864 304 R0
WINDOW 0 0 -64 Center 1
WINDOW 3 0 64 Center 1
SYMATTR InstName X5_PWM
SYMATTR Value NE555
SYMBOL res 14052 176 R0
WINDOW 0 36 40 Left 1
WINDOW 3 36 76 Left 1
SYMATTR InstName Ra5_PWM
SYMATTR Value 1k
SYMBOL res 14052 256 R0
WINDOW 0 36 40 Left 1
WINDOW 3 36 76 Left 1
SYMATTR InstName Rb5_PWM
SYMATTR Value 10k
SYMBOL cap 14052 352 R0
WINDOW 0 24 8 Left 1
WINDOW 3 24 56 Left 1
SYMATTR InstName Ct_PWM
SYMATTR Value 10n
SYMBOL cap 14012 400 R0
WINDOW 0 24 8 Left 1
WINDOW 3 24 56 Left 1
SYMATTR InstName Ccv_PWM
SYMATTR Value 10n
SYMBOL OpAmps\opamp2 14268 304 R0
WINDOW 0 16 32 Left 1
WINDOW 3 16 96 Left 1
SYMATTR InstName Xu6_PWM
SYMATTR Value LM393
SYMBOL res 14352 272 R0
WINDOW 0 36 40 Left 1
WINDOW 3 36 76 Left 1
SYMATTR InstName Rpu_PWM
SYMATTR Value 10k
SYMBOL OpAmps\opamp2 15208 144 R0
WINDOW 0 16 32 Left 1
WINDOW 3 16 96 Left 1
SYMATTR InstName Xbr_ERR
SYMATTR Value LM358
SYMBOL OpAmps\opamp2 15208 352 R0
WINDOW 0 16 32 Left 1
WINDOW 3 16 96 Left 1
SYMATTR InstName Xbs_ERR
SYMATTR Value LM358
SYMBOL OpAmps\opamp2 15208 560 R0
WINDOW 0 16 32 Left 1
WINDOW 3 16 96 Left 1
SYMATTR InstName Xbo_ERR
SYMATTR Value LM358
SYMBOL res 14992 528 R0
WINDOW 0 36 40 Left 1
WINDOW 3 36 76 Left 1
SYMATTR InstName Rv1_ERR
SYMATTR Value 4.7k
SYMBOL res 14992 608 R0
WINDOW 0 36 40 Left 1
WINDOW 3 36 76 Left 1
SYMATTR InstName Rv2_ERR
SYMATTR Value 5.1k
SYMBOL cap 15056 624 R0
WINDOW 0 24 8 Left 1
WINDOW 3 24 56 Left 1
SYMATTR InstName Cv_ERR
SYMATTR Value 100n
SYMBOL res 15504 384 R90
WINDOW 0 -56 -6 Center 1
WINDOW 3 -56 44 Center 1
SYMATTR InstName R1_ERR
SYMATTR Value 10k
SYMBOL res 15504 448 R90
WINDOW 0 -56 -6 Center 1
WINDOW 3 -56 44 Center 1
SYMATTR InstName R3_ERR
SYMATTR Value 10k
SYMBOL res 15696 488 R0
WINDOW 0 36 40 Left 1
WINDOW 3 36 76 Left 1
SYMATTR InstName R4_ERR
SYMATTR Value {Kerr*10k}
SYMBOL res 15808 288 R90
WINDOW 0 -56 -6 Center 1
WINDOW 3 -56 44 Center 1
SYMATTR InstName Rf6_ERR
SYMATTR Value {Kerr*10k}
SYMBOL cap 15776 240 R90
SYMATTR InstName Cf6_ERR
SYMATTR Value 10n
SYMBOL OpAmps\opamp2 15908 352 R0
WINDOW 0 16 32 Left 1
WINDOW 3 16 96 Left 1
SYMATTR InstName Xu2b_ERR
SYMATTR Value LM358
SYMBOL res 16084 400 R90
WINDOW 0 -56 -6 Center 1
WINDOW 3 -56 44 Center 1
SYMATTR InstName Ro_ERR
SYMATTR Value 1k
SYMBOL cap 16052 416 R0
WINDOW 0 24 8 Left 1
WINDOW 3 24 56 Left 1
SYMATTR InstName Cvc_ERR
SYMATTR Value 100n
SYMBOL res 16672 80 R0
WINDOW 0 36 40 Left 1
WINDOW 3 36 76 Left 1
SYMATTR InstName Rt_REF
SYMATTR Value 68k
SYMBOL res 16672 160 R0
WINDOW 0 36 40 Left 1
WINDOW 3 36 76 Left 1
SYMATTR InstName Rp1_REF
SYMATTR Value {10k*kvn}
SYMBOL res 16768 160 R0
WINDOW 0 36 40 Left 1
WINDOW 3 36 76 Left 1
SYMATTR InstName Rp2_REF
SYMATTR Value {10k*kvr}
SYMBOL npn 16720 256 R0
WINDOW 0 56 32 Left 1
WINDOW 3 56 68 Left 1
SYMATTR InstName Q5_REF
SYMATTR Value Q2N3904
SYMBOL res 16720 288 R90
WINDOW 0 -56 -6 Center 1
WINDOW 3 -56 44 Center 1
SYMATTR InstName Rb5_REF
SYMATTR Value 10k
SYMBOL cap 16832 176 R0
WINDOW 0 24 8 Left 1
WINDOW 3 24 56 Left 1
SYMATTR InstName Cr_REF
SYMATTR Value 100n
SYMBOL res 17704 128 R0
WINDOW 0 36 40 Left 1
WINDOW 3 36 76 Left 1
SYMATTR InstName Rled_ENC
SYMATTR Value 220
SYMBOL LED 17704 224 R0
WINDOW 0 24 0 Left 1
WINDOW 3 24 64 Left 1
SYMATTR InstName Dled_ENC
SYMATTR Value DIR
SYMBOL res 17824 128 R0
WINDOW 0 36 40 Left 1
WINDOW 3 36 76 Left 1
SYMATTR InstName Rpe_ENC
SYMATTR Value 10k
SYMBOL OpAmps\opamp2 18160 144 R0
WINDOW 0 16 32 Left 1
WINDOW 3 16 96 Left 1
SYMATTR InstName Xu7_ENC
SYMATTR Value LM393
SYMBOL res 18048 240 R0
WINDOW 0 36 40 Left 1
WINDOW 3 36 76 Left 1
SYMATTR InstName Ru1_ENC
SYMATTR Value 10k
SYMBOL res 18048 320 R0
WINDOW 0 36 40 Left 1
WINDOW 3 36 76 Left 1
SYMATTR InstName Ru2_ENC
SYMATTR Value 10k
SYMBOL res 18240 112 R0
WINDOW 0 36 40 Left 1
WINDOW 3 36 76 Left 1
SYMATTR InstName Rpq_ENC
SYMATTR Value 10k
SYMBOL res 18176 256 R0
WINDOW 0 36 40 Left 1
WINDOW 3 36 76 Left 1
SYMATTR InstName Rhe_ENC
SYMATTR Value 1Meg
SYMBOL cap 18384 192 R90
SYMATTR InstName Cd_ENC
SYMATTR Value 1n
SYMBOL res 18368 112 R0
WINDOW 0 36 40 Left 1
WINDOW 3 36 76 Left 1
SYMATTR InstName Rtg_ENC
SYMATTR Value 10k
SYMBOL diode 18464 208 R180
SYMATTR InstName Dcl_ENC
SYMATTR Value D1N4148
SYMBOL Misc\NE555 18640 256 R0
WINDOW 0 0 -64 Center 1
WINDOW 3 0 64 Center 1
SYMATTR InstName X7_ENC
SYMATTR Value NE555
SYMBOL res 18832 128 R0
WINDOW 0 36 40 Left 1
WINDOW 3 36 76 Left 1
SYMATTR InstName Rt7_ENC
SYMATTR Value 20k
SYMBOL cap 18832 224 R0
WINDOW 0 24 8 Left 1
WINDOW 3 24 56 Left 1
SYMATTR InstName Ct7_ENC
SYMATTR Value 10n
SYMBOL cap 18784 352 R0
WINDOW 0 24 8 Left 1
WINDOW 3 24 56 Left 1
SYMATTR InstName Ccvm_ENC
SYMATTR Value 10n
SYMBOL HC_BUF 19040 256 R0
WINDOW 0 36 -16 Left 1
WINDOW 3 0 0 Left 0
SYMATTR InstName Xb1_ENC
SYMATTR Value HC_BUF
SYMBOL res 19200 240 R90
WINDOW 0 -56 -6 Center 1
WINDOW 3 -56 44 Center 1
SYMATTR InstName Rfv_ENC
SYMATTR Value 10k
SYMBOL cap 19168 256 R0
WINDOW 0 24 8 Left 1
WINDOW 3 24 56 Left 1
SYMATTR InstName Cfv_ENC
SYMATTR Value 1u
SYMBOL res 19312 240 R90
WINDOW 0 -56 -6 Center 1
WINDOW 3 -56 44 Center 1
SYMATTR InstName Rfv2_ENC
SYMATTR Value 10k
SYMBOL cap 19280 256 R0
WINDOW 0 24 8 Left 1
WINDOW 3 24 56 Left 1
SYMATTR InstName Cfv2_ENC
SYMATTR Value 1u
TEXT 4308 -290 Left 3 ;BLOQUE 1 - REGULADOR DE 5 V
TEXT 5452 -290 Left 3 ;BLOQUE 2 - SENSOR OPTICO IR
TEXT 5442 554 Left 2 ;LED infrarrojo (~14 mA)
TEXT 6142 412 Left 2 ;trimpot 10k
TEXT 6352 234 Left 2 ;histeresis
TEXT 6222 164 Left 2 ;pull-up
TEXT 6784 -290 Left 3 ;BLOQUE 3 - SOBRECORRIENTE
TEXT 7674 492 Left 2 ;trimpot 10k
TEXT 8096 -290 Left 3 ;BLOQUE 4 - SOBRETEMPERATURA
TEXT 8116 174 Left 2 ;NTC 10k (externo): v5 -> tnode
TEXT 8526 236 Left 2 ;trimpot 10k
TEXT 9232 -290 Left 3 ;BLOQUE 5 - LOGICA COMBINACIONAL
TEXT 9342 720 Left 2 ;reset automatico al encender
TEXT 10002 90 Left 2 ;pestillo (74HC00): setn = 0 pone F = 1
TEXT 10002 630 Left 2 ;P' = NAND(P,P)
TEXT 10482 90 Left 2 ;decision (74HC08)
TEXT 10968 -290 Left 3 ;BLOQUE 11 - ALARMA
TEXT 11264 96 Left 2 ;buzzer activo 12 V (~30 mA)
TEXT 10978 246 Left 2 ;LED rojo (~8 mA)
TEXT 12128 -290 Left 3 ;BLOQUE 7 - SEGURIDAD, EXCITADOR Y MOSFET
TEXT 13468 -290 Left 3 ;BLOQUE 6 - GENERADOR DE PWM
TEXT 14788 -290 Left 3 ;BLOQUE 10 - AMPLIFICADOR DE ERROR (LAZO CERRADO)
TEXT 16528 -290 Left 3 ;BLOQUE 9 - REFERENCIA DE VELOCIDAD
TEXT 17660 -290 Left 3 ;BLOQUE 8 - ENCODER Y CONVERTIDOR FRECUENCIA-VOLTAJE
TEXT 17650 314 Left 2 ;LED del optointerruptor
TEXT 17780 254 Left 2 ;fototransistor
TEXT -876 -152 Left 3 ;RIEL +5 V
TEXT -876 -216 Left 3 ;RIEL +12 V (despues del diodo)
TEXT -876 1064 Left 3 ;RIEL TIERRA (GND)
TEXT 0 1364 Left 2 !
TEXT 0 -300 Left 4 ;SISTEMA - SOLO EL CIRCUITO (bloques 1 a 11 de izquierda a derecha, tal como esta en el 3D)
TEXT 0 -245 Left 2 ;SOLO EL CIRCUITO, igual que en el 3D (sin fuentes de simulacion). Los TERMINALES (nombres en mayuscula) son donde se conectan el jack, el interruptor E, la cubierta, el reset, el sensor IR, el NTC, el encoder y el motor.
TEXT 4308 1180 Left 2 ;vm (12 V despues del diodo) -> v5 (5 V). El Zener fija 5.6 V en la base de Q1 y la salida es esa tension menos 0.7 V.
TEXT 4308 1204 Left 2 ;Rtr (trimpot de 100 ohm) sube la salida unas decenas de mV para llevarla a 5.0 V.
TEXT 4308 1228 Left 2 ;DZ = Zener 1N4734A (5.6 V, 1 W). Q1 = BD139 con disipador: en el peor caso (13 V, 120 mA) disipa ~0.9 W.
TEXT 4308 1252 Left 2 ;Cout (100 uF) y C2 (100 nF) filtran la salida. La resistencia Rz (510 ohm) deja ~9 mA en el Zener.
TEXT 5442 1180 Left 2 ;Sin objeto: ~2 uA -> c queda en ~4.2 V (sobre el umbral) y p = 0. Con objeto: ~50 uA -> c baja a ~2.9 V y p = 1.
TEXT 5442 1204 Left 2 ;Ganancia de Q2 = -Rc / (re + RE) = -680 / (14 + 150) = -4. El trimpot mueve el umbral entre 2.9 V y 3.9 V.
TEXT 5452 1228 Left 2 ;El fototransistor (TCRT5000) inyecta su corriente en el nodo b. Q2 (emisor comun) la amplifica.
TEXT 5452 1252 Left 2 ;El comparador (con histeresis por Rh) pone p = 1 cuando hay objeto.
TEXT 6784 1180 Left 2 ;La caida en el shunt (0.5 ohm, nodo sh) la amplifica el LM358: ganancia 1 + Rf/Rg = 7.8.
TEXT 6784 1204 Left 2 ;D1 y Cpk guardan el pico; Rd y Cd retrasan ~0.1 s (ignora el arranque); el comparador baja setn si hay falla.
TEXT 6784 1228 Left 2 ;Corriente de disparo ~ (Vref + 0.6 V) / (0.5 ohm x 7.8). Con Vref = 2 V: ~0.67 A. El trimpot Rp ajusta Vref.
TEXT 6784 1252 Left 2 ;Cd = 10 uF con Rd = 10k da ~0.1 s de retardo: el arranque del motor (~30 ms) no dispara, una sobrecarga sostenida si.
TEXT 8096 1180 Left 2 ;El NTC de 10k va entre v5 y tnode; Rfix completa el divisor, asi tnode sube al calentarse.
TEXT 8096 1204 Left 2 ;Si tnode supera el umbral (trimpot, 45 a 55 C) el comparador baja setn. Rh da ~2.6 C de histeresis.
TEXT 8096 1228 Left 2 ;NTC a 50 C = 3.6k -> tnode = 3.7 V. El trimpot mueve Vref de 3.4 V (44 C) a 3.9 V (57 C).
TEXT 9232 1180 Left 2 ;Entradas: E (habilitar), G (cubierta cerrada), P (objeto), setn (falla de corriente o temperatura, activa en bajo) y el boton de reset.
TEXT 9232 1204 Left 2 ;Salidas: M = E.G.F' N = M.P' L = M.P A = F. F es un pestillo NAND: recuerda la falla hasta pulsar reset.
TEXT 9372 1228 Left 2 ;Rp: cable roto = 0 (seguro). Rs + C: antirrebote (1 ms). Dos inversores Schmitt (74HC14): senal limpia.
TEXT 10968 1180 Left 2 ;Cuando f = 1 (falla enclavada), Q6 conduce como interruptor y enciende el buzzer de 12 V
TEXT 10968 1204 Left 2 ;(en la simulacion el buzzer se representa con Rbz de 400 ohm). El LED indica la falla con luz.
TEXT 10968 1228 Left 2 ;Ib = (4.9 - 0.7 V) / 1k = 4 mA. Ic = 30 mA. Ic/Ib = 7.5, menor que hFE: el transistor trabaja saturado, como interruptor.
TEXT 12128 1180 Left 2 ;La compuerta AND deja pasar el PWM solo si M = 1: la seguridad manda sobre el PWM.
TEXT 12128 1204 Left 2 ;Q3 y Q4 (seguidor complementario) cargan y descargan la compuerta de M1. Dfw protege contra el pico del motor.
TEXT 12128 1228 Left 2 ;El motor va entre vm y dm. Con M1 encendido la corriente baja por el motor, M1 y el shunt Rsh (0.5 ohm, 5 W).
TEXT 12128 1252 Left 2 ;Al apagar M1 el motor sigue empujando corriente: pasa por Dfw (Schottky 1N5819) de dm a vm.
TEXT 12128 1276 Left 2 ;M1 = IRFZ44N: con 4.3 V en la compuerta conduce con ~0.07 ohm (con 10 V seria 0.02). Rg limita la corriente de la compuerta.
TEXT 13468 1180 Left 2 ;El NE555 oscila (~7 kHz): el nodo tri sube y baja entre 1.7 y 3.3 V (rampa).
TEXT 13468 1204 Left 2 ;El comparador pone pwm = 1 mientras vctrl > tri: a mayor vctrl, pulsos mas anchos.
TEXT 13468 1228 Left 2 ;f = 1.44 / ((Ra5 + 2 Rb5) Ct) = 1.44 / (21k x 10 nF) = 6.9 kHz. Ciclo de trabajo = (vctrl - 1.7 V) / 1.7 V: vctrl = 2.5 V da ~50 %.
TEXT 13468 1252 Left 2 ;El pin 3 del 555 (tri_o) no se usa: la rampa se toma del condensador Ct.
TEXT 14788 1180 Left 2 ;Tres seguidores (Xbr, Xbs, Xbo) aislan vref, la velocidad medida y el nivel Voff. Xu2b resta y multiplica por Kerr = 10:
TEXT 14788 1204 Left 2 ;vctrl = Kerr (vref - vspd) + Voff. Si la velocidad baja, vctrl sube y el PWM da mas potencia al motor.
TEXT 14788 1228 Left 2 ;Kerr = 10: un error de 0.1 V mueve vctrl 1 V. Voff = 2.6 V es el punto de partida (~55 % de PWM).
TEXT 14788 1252 Left 2 ;Un solo circuito integrado LM324 (cuatro amplificadores) contiene Xbr, Xbs, Xbo y Xu2b.
TEXT 16528 1180 Left 2 ;Rt y el trimpot Rp1 fijan la referencia normal (~0.53 V).
TEXT 16528 1204 Left 2 ;Si l = 1, Q5 conecta Rp2 y baja vref a la mitad (velocidad reducida).
TEXT 16528 1228 Left 2 ;Rp1 y Rp2 son dos trimpots de 10k (normal y reducida): en la simulacion kvn y kvr indican la posicion del cursor.
TEXT 16528 1252 Left 2 ;Reducida = 50 % de la normal (el enunciado pide entre 40 % y 60 %).
TEXT 17660 1180 Left 2 ;El fototransistor del optointerruptor (nodo enc, con pull-up Rpe) da pulsos al pasar las ranuras del disco. El comparador Xu7 los limpia.
TEXT 17660 1204 Left 2 ;El 555 monoestable da un pulso fijo de 220 us por cada uno; el filtro RC doble lo vuelve voltaje: vspd = 1.1 mV por Hz.
TEXT 17660 1228 Left 2 ;tw = 1.1 x Rt7 x Ct7 = 1.1 x 20k x 10 nF = 220 us. Vspd = 5 V x tw x f. A 500 Hz: 0.55 V.
TEXT 17660 1252 Left 2 ;Dcl protege la entrada del 555 contra el pico positivo del derivador (Cd y Rtg dan un pulso corto en cada flanco de bajada).
TEXT -880 20 Left 2 ;ENTRADAS (lo unico que se conecta desde afuera):
TEXT -880 60 Left 1 ;J1_JACK_12V = entra aqui el + del jack de 12 V (antes del diodo D1)
TEXT -880 86 Left 1 ;INTERRUPTOR_E = interruptor E: va entre +5 V y este punto
TEXT -880 112 Left 1 ;CUBIERTA_G = micro-switch de la cubierta G: va entre +5 V y este punto
TEXT -880 138 Left 1 ;BOTON_RESET = pulsador de reset: va entre +5 V y este punto
TEXT -880 164 Left 1 ;SENSOR_IR_TCRT5000 = emisor del fototransistor del sensor IR (el que detecta el objeto)
TEXT -880 190 Left 1 ;NTC_10k = termistor NTC 10 k: va entre +5 V y este punto
TEXT -880 216 Left 1 ;ENCODER_SALIDA = salida del fototransistor del encoder (cuenta las vueltas)
TEXT -880 242 Left 1 ;MOTOR_NEGATIVO = cable negativo (M-) del motor; el M+ va a +12 V

The netlist it stands for:
* SISTEMA_SOLO_CIRCUITO.asc
D1 J1_JACK_12V vm D1N4007
Cin vm 0 1000u
Rz_REG vm N001 510
DZ_REG P001 N001 D1N4734
Rtr_REG P001 0 10
Q1_REG vm N001 v5 0 QBD139
Cout_REG v5 0 100u
C2_REG v5 0 100n
Rled_SEN v5 P002 270
Dled_SEN P002 0 DIR
R1_SEN v5 SENSOR_IR_TCRT5000 47k
R2_SEN SENSOR_IR_TCRT5000 0 10k
Q2_SEN N002 SENSOR_IR_TCRT5000 P003 0 Q2N3904
Rc_SEN v5 N002 680
RE_SEN P003 0 150
Ra_SEN v5 P004 10k
Rp1_SEN P004 N003 {10k*(1-kir)}
Rp2_SEN N003 P005 {10k*kir}
Rb_SEN P005 0 26.8k
XXu1_SEN N003 N002 v5 0 N004 LM393  ; pins In+ In- V+ V- OUT
Rpu_SEN v5 N004 10k
Rh_SEN N004 N003 220k
XXu2_OC N056 N005 vm 0 N006 LM358  ; pins In+ In- V+ V- OUT
Rg_OC N005 0 1k
Rf_OC N006 N005 6.8k
D1_OC N006 N007 D1N4148
Cpk_OC N007 0 100n
Rbl_OC N007 0 22k
Rd_OC N008 N007 10k
Cd_OC N008 0 10u
XXu3_OC N010 N008 v5 0 N009 LM393  ; pins In+ In- V+ V- OUT
Ra_OC v5 P006 10k
Rp1_OC P006 N010 {10k*(1-koc)}
Rp2_OC N010 P007 {10k*koc}
Rb_OC P007 0 10k
Rfix_TMP NTC_10k 0 10k
Ra_TMP v5 P008 22k
Rp1_TMP P008 N011 {10k*(1-ktm)}
Rp2_TMP N011 P009 {10k*ktm}
Rb_TMP P009 0 68k
XXu4_TMP N011 NTC_10k v5 0 N009 LM393  ; pins In+ In- V+ V- OUT
Rh_TMP N009 N011 1Meg
Rpe_LOG INTERRUPTOR_E 0 10k
Rse_LOG N012 INTERRUPTOR_E 10k
Cef_LOG N012 0 100n
XXi1_LOG N012 N013 v5 HC_SCHINV  ; pins a y vcc
XXi2_LOG N013 N014 v5 HC_SCHINV  ; pins a y vcc
Rpg_LOG CUBIERTA_G 0 10k
Rsg_LOG N015 CUBIERTA_G 10k
Cgf_LOG N015 0 100n
XXi3_LOG N015 N016 v5 HC_SCHINV  ; pins a y vcc
XXi4_LOG N016 N017 v5 HC_SCHINV  ; pins a y vcc
Rpr_LOG BOTON_RESET 0 10k
Rsr_LOG N018 BOTON_RESET 10k
Crf_LOG N018 0 100n
XXi5_LOG N018 N019 v5 HC_SCHINV  ; pins a y vcc
XXi6_LOG N019 N020 v5 HC_SCHINV  ; pins a y vcc
Cpor_LOG v5 N021 1u
Rpor_LOG N021 0 47k
Dpor_LOG N021 N018 D1N4148
XXg1_LOG N020 N009 N022 v5 HC_NAND2  ; pins a b y vcc
XXg2_LOG N009 N024 N023 v5 HC_NAND2  ; pins a b y vcc
XXg3_LOG N022 N023 N024 v5 HC_NAND2  ; pins a b y vcc
XXg4_LOG N004 N004 N025 v5 HC_NAND2  ; pins a b y vcc
Rsn_LOG v5 N009 10k
XXa1_LOG N014 N017 N026 v5 HC_AND2  ; pins a b y vcc
XXa2_LOG N026 N024 N027 v5 HC_AND2  ; pins a b y vcc
XXa3_LOG N027 N025 N028 v5 HC_AND2  ; pins a b y vcc
XXa4_LOG N027 N004 N029 v5 HC_AND2  ; pins a b y vcc
Rb_ALA P010 N023 1k
Q6_ALA P011 P010 0 0 Q2N3904
Rbz_ALA vm P011 400
Rl_ALA N023 P012 470
Dl_ALA P012 0 DLED
XXa5_POT N030 N027 N031 v5 HC_AND2  ; pins a b y vcc
Q3_POT v5 N031 N032 0 Q2N3904
Q4_POT 0 N031 N032 0 Q2N3906
Rg_POT N033 N032 47
Rpd_POT N033 0 10k
M1_POT MOTOR_NEGATIVO N033 N056 N056 IRFZ44N_P
Dfw_POT MOTOR_NEGATIVO vm D1N5819
Rsh_POT N056 0 0.5
XX5_PWM 0 N035 NC_01 v5 N036 N035 N034 v5 NE555  ; pins GND TRIG OUT RST CV THRS DIS Vcc
Ra5_PWM v5 N034 1k
Rb5_PWM N034 N035 10k
Ct_PWM N035 0 10n
Ccv_PWM N036 0 10n
XXu6_PWM N044 N035 v5 0 N030 LM393  ; pins In+ In- V+ V- OUT
Rpu_PWM v5 N030 10k
XXbr_ERR N045 N037 vm 0 N037 LM358  ; pins In+ In- V+ V- OUT
XXbs_ERR N055 N038 vm 0 N038 LM358  ; pins In+ In- V+ V- OUT
XXbo_ERR N040 N039 vm 0 N039 LM358  ; pins In+ In- V+ V- OUT
Rv1_ERR v5 N040 4.7k
Rv2_ERR N040 0 5.1k
Cv_ERR N040 0 100n
R1_ERR N041 N038 10k
R3_ERR N042 N037 10k
R4_ERR N039 N042 {Kerr*10k}
Rf6_ERR N043 N041 {Kerr*10k}
Cf6_ERR N043 N041 10n
XXu2b_ERR N042 N041 vm 0 N043 LM358  ; pins In+ In- V+ V- OUT
Ro_ERR N044 N043 1k
Cvc_ERR N044 0 100n
Rt_REF v5 N045 68k
Rp1_REF N045 0 {10k*kvn}
Rp2_REF N045 P013 {10k*kvr}
Q5_REF P013 N046 0 0 Q2N3904
Rb5_REF N046 N029 10k
Cr_REF N045 0 100n
Rled_ENC v5 P014 220
Dled_ENC P014 0 DIR
Rpe_ENC v5 ENCODER_SALIDA 10k
XXu7_ENC N047 ENCODER_SALIDA v5 0 N048 LM393  ; pins In+ In- V+ V- OUT
Ru1_ENC v5 N047 10k
Ru2_ENC N047 0 10k
Rpq_ENC v5 N048 10k
Rhe_ENC N048 N047 1Meg
Cd_ENC N049 N048 1n
Rtg_ENC v5 N049 10k
Dcl_ENC N049 v5 D1N4148
XX7_ENC 0 N049 N052 v5 N051 N050 N050 v5 NE555  ; pins GND TRIG OUT RST CV THRS DIS Vcc
Rt7_ENC v5 N050 20k
Ct7_ENC N050 0 10n
Ccvm_ENC N051 0 10n
XXb1_ENC N052 N053 v5 HC_BUF  ; pins a y vcc
Rfv_ENC N054 N053 10k
Cfv_ENC N054 0 1u
Rfv2_ENC N055 N054 10k
Cfv2_ENC N055 0 1u
.model D D
.lib standard.dio
.model NPN NPN
.model PNP PNP
.lib standard.bjt
.model NMOS NMOS
.model PMOS PMOS
.lib standard.mos
* BLOQUE 1 - REGULADOR DE 5 V
* BLOQUE 2 - SENSOR OPTICO IR
* LED infrarrojo (~14 mA)
* trimpot 10k
* histeresis
* pull-up
* BLOQUE 3 - SOBRECORRIENTE
* trimpot 10k
* BLOQUE 4 - SOBRETEMPERATURA
* NTC 10k (externo): v5 -> tnode
* trimpot 10k
* BLOQUE 5 - LOGICA COMBINACIONAL
* reset automatico al encender
* pestillo (74HC00): setn = 0 pone F = 1
* P' = NAND(P,P)
* decision (74HC08)
* BLOQUE 11 - ALARMA
* buzzer activo 12 V (~30 mA)
* LED rojo (~8 mA)
* BLOQUE 7 - SEGURIDAD, EXCITADOR Y MOSFET
* BLOQUE 6 - GENERADOR DE PWM
* BLOQUE 10 - AMPLIFICADOR DE ERROR (LAZO CERRADO)
* BLOQUE 9 - REFERENCIA DE VELOCIDAD
* BLOQUE 8 - ENCODER Y CONVERTIDOR FRECUENCIA-VOLTAJE
* LED del optointerruptor
* fototransistor
* RIEL +5 V
* RIEL +12 V (despues del diodo)
* RIEL TIERRA (GND)
* SISTEMA - SOLO EL CIRCUITO (bloques 1 a 11 de izquierda a derecha, tal como esta en el 3D)
* SOLO EL CIRCUITO, igual que en el 3D (sin fuentes de simulacion). Los TERMINALES (nombres en mayuscula) son donde se conectan el jack, el interruptor E, la cubierta, el reset, el sensor IR, el NTC, el encoder y el motor.
* vm (12 V despues del diodo) -> v5 (5 V). El Zener fija 5.6 V en la base de Q1 y la salida es esa tension menos 0.7 V.
* Rtr (trimpot de 100 ohm) sube la salida unas decenas de mV para llevarla a 5.0 V.
* DZ = Zener 1N4734A (5.6 V, 1 W). Q1 = BD139 con disipador: en el peor caso (13 V, 120 mA) disipa ~0.9 W.
* Cout (100 uF) y C2 (100 nF) filtran la salida. La resistencia Rz (510 ohm) deja ~9 mA en el Zener.
* Sin objeto: ~2 uA -> c queda en ~4.2 V (sobre el umbral) y p = 0. Con objeto: ~50 uA -> c baja a ~2.9 V y p = 1.
* Ganancia de Q2 = -Rc / (re + RE) = -680 / (14 + 150) = -4. El trimpot mueve el umbral entre 2.9 V y 3.9 V.
* El fototransistor (TCRT5000) inyecta su corriente en el nodo b. Q2 (emisor comun) la amplifica.
* El comparador (con histeresis por Rh) pone p = 1 cuando hay objeto.
* La caida en el shunt (0.5 ohm, nodo sh) la amplifica el LM358: ganancia 1 + Rf/Rg = 7.8.
* D1 y Cpk guardan el pico; Rd y Cd retrasan ~0.1 s (ignora el arranque); el comparador baja setn si hay falla.
* Corriente de disparo ~ (Vref + 0.6 V) / (0.5 ohm x 7.8). Con Vref = 2 V: ~0.67 A. El trimpot Rp ajusta Vref.
* Cd = 10 uF con Rd = 10k da ~0.1 s de retardo: el arranque del motor (~30 ms) no dispara, una sobrecarga sostenida si.
* El NTC de 10k va entre v5 y tnode; Rfix completa el divisor, asi tnode sube al calentarse.
* Si tnode supera el umbral (trimpot, 45 a 55 C) el comparador baja setn. Rh da ~2.6 C de histeresis.
* NTC a 50 C = 3.6k -> tnode = 3.7 V. El trimpot mueve Vref de 3.4 V (44 C) a 3.9 V (57 C).
* Entradas: E (habilitar), G (cubierta cerrada), P (objeto), setn (falla de corriente o temperatura, activa en bajo) y el boton de reset.
* Salidas: M = E.G.F' N = M.P' L = M.P A = F. F es un pestillo NAND: recuerda la falla hasta pulsar reset.
* Rp: cable roto = 0 (seguro). Rs + C: antirrebote (1 ms). Dos inversores Schmitt (74HC14): senal limpia.
* Cuando f = 1 (falla enclavada), Q6 conduce como interruptor y enciende el buzzer de 12 V
* (en la simulacion el buzzer se representa con Rbz de 400 ohm). El LED indica la falla con luz.
* Ib = (4.9 - 0.7 V) / 1k = 4 mA. Ic = 30 mA. Ic/Ib = 7.5, menor que hFE: el transistor trabaja saturado, como interruptor.
* La compuerta AND deja pasar el PWM solo si M = 1: la seguridad manda sobre el PWM.
* Q3 y Q4 (seguidor complementario) cargan y descargan la compuerta de M1. Dfw protege contra el pico del motor.
* El motor va entre vm y dm. Con M1 encendido la corriente baja por el motor, M1 y el shunt Rsh (0.5 ohm, 5 W).
* Al apagar M1 el motor sigue empujando corriente: pasa por Dfw (Schottky 1N5819) de dm a vm.
* M1 = IRFZ44N: con 4.3 V en la compuerta conduce con ~0.07 ohm (con 10 V seria 0.02). Rg limita la corriente de la compuerta.
* El NE555 oscila (~7 kHz): el nodo tri sube y baja entre 1.7 y 3.3 V (rampa).
* El comparador pone pwm = 1 mientras vctrl > tri: a mayor vctrl, pulsos mas anchos.
* f = 1.44 / ((Ra5 + 2 Rb5) Ct) = 1.44 / (21k x 10 nF) = 6.9 kHz. Ciclo de trabajo = (vctrl - 1.7 V) / 1.7 V: vctrl = 2.5 V da ~50 %.
* El pin 3 del 555 (tri_o) no se usa: la rampa se toma del condensador Ct.
* Tres seguidores (Xbr, Xbs, Xbo) aislan vref, la velocidad medida y el nivel Voff. Xu2b resta y multiplica por Kerr = 10:
* vctrl = Kerr (vref - vspd) + Voff. Si la velocidad baja, vctrl sube y el PWM da mas potencia al motor.
* Kerr = 10: un error de 0.1 V mueve vctrl 1 V. Voff = 2.6 V es el punto de partida (~55 % de PWM).
* Un solo circuito integrado LM324 (cuatro amplificadores) contiene Xbr, Xbs, Xbo y Xu2b.
* Rt y el trimpot Rp1 fijan la referencia normal (~0.53 V).
* Si l = 1, Q5 conecta Rp2 y baja vref a la mitad (velocidad reducida).
* Rp1 y Rp2 son dos trimpots de 10k (normal y reducida): en la simulacion kvn y kvr indican la posicion del cursor.
* Reducida = 50 % de la normal (el enunciado pide entre 40 % y 60 %).
* El fototransistor del optointerruptor (nodo enc, con pull-up Rpe) da pulsos al pasar las ranuras del disco. El comparador Xu7 los limpia.
* El 555 monoestable da un pulso fijo de 220 us por cada uno; el filtro RC doble lo vuelve voltaje: vspd = 1.1 mV por Hz.
* tw = 1.1 x Rt7 x Ct7 = 1.1 x 20k x 10 nF = 220 us. Vspd = 5 V x tw x f. A 500 Hz: 0.55 V.
* Dcl protege la entrada del 555 contra el pico positivo del derivador (Cd y Rtg dan un pulso corto en cada flanco de bajada).
* ENTRADAS (lo unico que se conecta desde afuera):
* J1_JACK_12V = entra aqui el + del jack de 12 V (antes del diodo D1)
* INTERRUPTOR_E = interruptor E: va entre +5 V y este punto
* CUBIERTA_G = micro-switch de la cubierta G: va entre +5 V y este punto
* BOTON_RESET = pulsador de reset: va entre +5 V y este punto
* SENSOR_IR_TCRT5000 = emisor del fototransistor del sensor IR (el que detecta el objeto)
* NTC_10k = termistor NTC 10 k: va entre +5 V y este punto
* ENCODER_SALIDA = salida del fototransistor del encoder (cuenta las vueltas)
* MOTOR_NEGATIVO = cable negativo (M-) del motor; el M+ va a +12 V
.lib NE555.sub
.backanno
.end